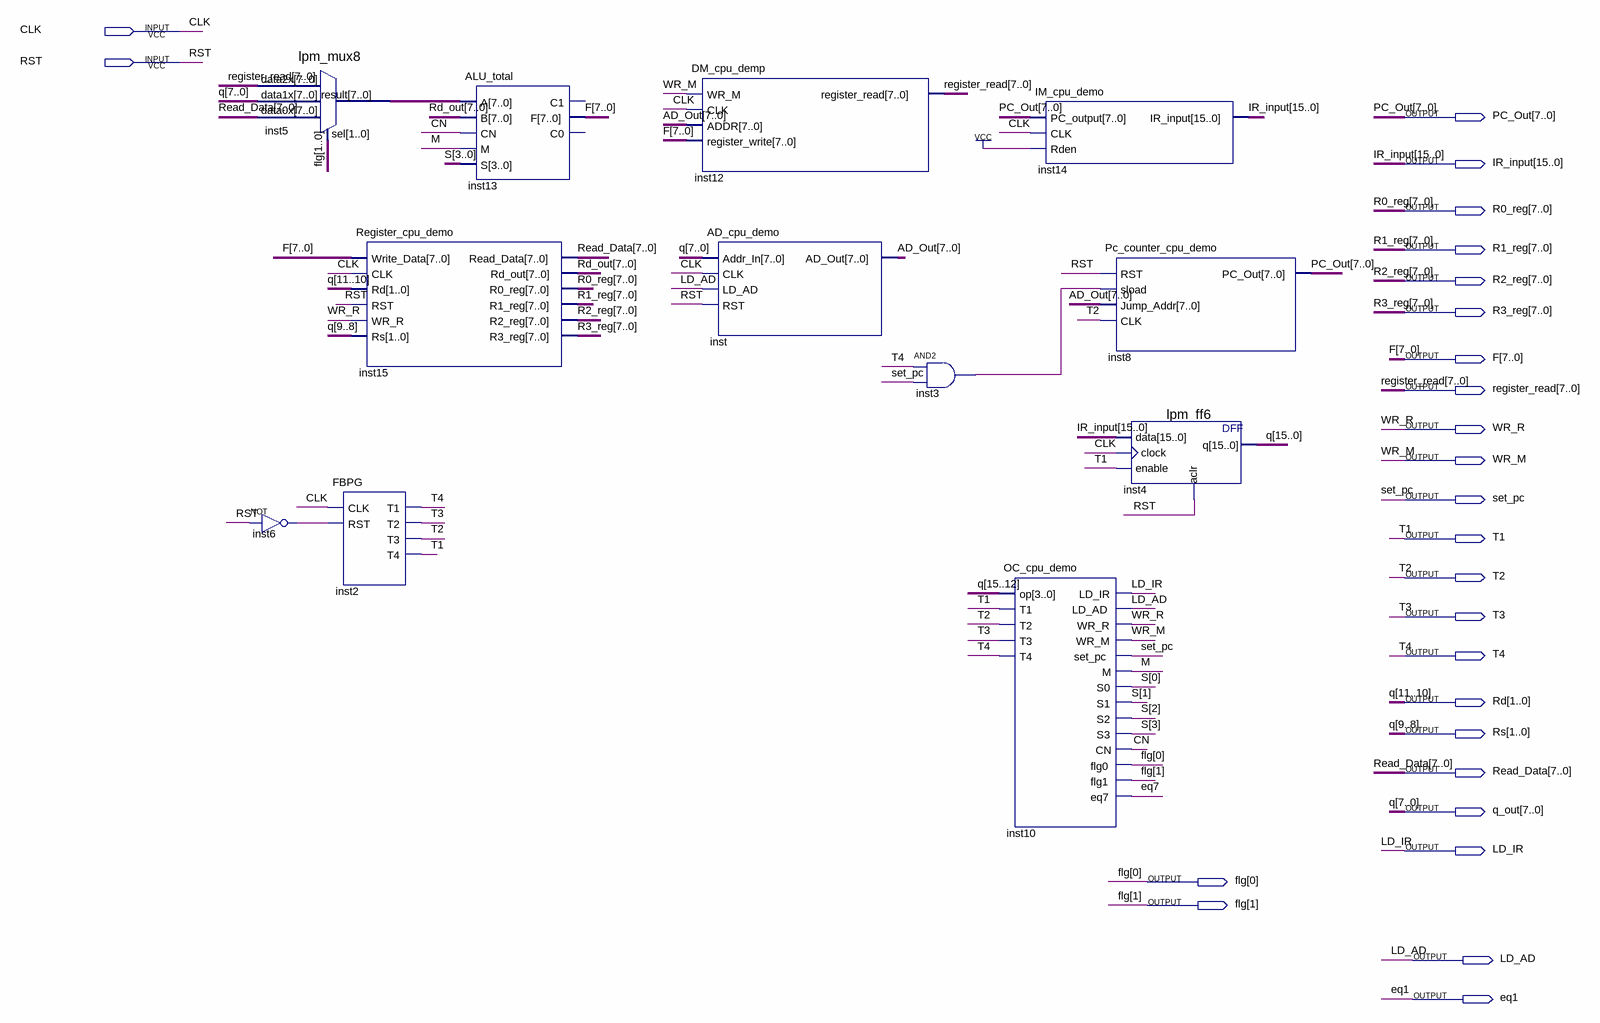
[diagram p0: schematic sheet]
// Quartus schematic CPU_top.bdf as structural Verilog: 12 symbols, 26 pins
module CPU_top (
  input  CLK,
  input  RST,
  output [7:0] PC_Out,
  output [15:0] IR_input,
  output [7:0] R0_reg,
  output [7:0] R1_reg,
  output [7:0] R2_reg,
  output [7:0] R3_reg,
  output [7:0] F,
  output [7:0] register_read,
  output WR_R,
  output WR_M,
  output set_pc,
  output T1,
  output T2,
  output T3,
  output T4,
  output [1:0] Rd,
  output [1:0] Rs,
  output [7:0] Read_Data,
  output [7:0] q_out,
  output LD_IR,
  output [1:0] flg,
  output LD_AD,
  output eq1
);

  wire CN, eq7, inst3_out, inst6_out, M;
  wire [3:0] S;
  wire [7:0] AD_Out, inst5_result, Rd_out;
  wire [15:12] q;

  lpm_mux8 inst5 (.data2x(register_read), .data1x(q_out), .data0x(Read_Data), .sel(flg), .result(inst5_result));
  not inst6 (inst6_out, RST);
  Register_cpu_demo inst15 (
    .Write_Data(F), .CLK(CLK), .Rd(Rd), .RST(RST), .WR_R(WR_R), .Rs(Rs), .Read_Data(Read_Data),
    .Rd_out(Rd_out), .R0_reg(R0_reg), .R1_reg(R1_reg), .R2_reg(R2_reg), .R3_reg(R3_reg));
  FBPG inst2 (.CLK(CLK), .RST(inst6_out), .T1(T4), .T2(T3), .T3(T2), .T4(T1));
  ALU_total inst13 (.A(inst5_result), .B(Rd_out), .CN(CN), .M(M), .S(S), .F(F));  // open: C1, C0
  DM_cpu_demp inst12 (.WR_M(WR_M), .CLK(CLK), .ADDR(AD_Out), .register_write(F), .register_read(register_read));
  AD_cpu_demo inst (.Addr_In(q_out), .CLK(CLK), .LD_AD(LD_AD), .RST(RST), .AD_Out(AD_Out));
  and inst3 (inst3_out, T4, set_pc);
  OC_cpu_demo inst10 (
    .op(q), .T1(T1), .T2(T2), .T3(T3), .T4(T4), .LD_IR(LD_IR), .LD_AD(LD_AD), .WR_R(WR_R), .WR_M(WR_M),
    .set_pc(set_pc), .M(M), .S0(S[0]), .S1(S[1]), .S2(S[2]), .S3(S[3]), .CN(CN), .flg0(flg[0]),
    .flg1(flg[1]), .eq7(eq7));
  IM_cpu_demo inst14 (.PC_output(PC_Out), .CLK(CLK), .Rden(1'b1), .IR_input(IR_input));
  Pc_counter_cpu_demo inst8 (.RST(RST), .sload(inst3_out), .Jump_Addr(AD_Out), .CLK(T2), .PC_Out(PC_Out));
  lpm_ff6 inst4 (.data(IR_input), .clock(CLK), .enable(T1), .aclr(RST), .q({q, Rd, Rs, q_out}));

  // Other names for the same wires on the sheet: q[11:0] = {Rd, Rs, q_out}
endmodule
